# Altium schematic sheet ads1299_Ain.SchDoc
size A4
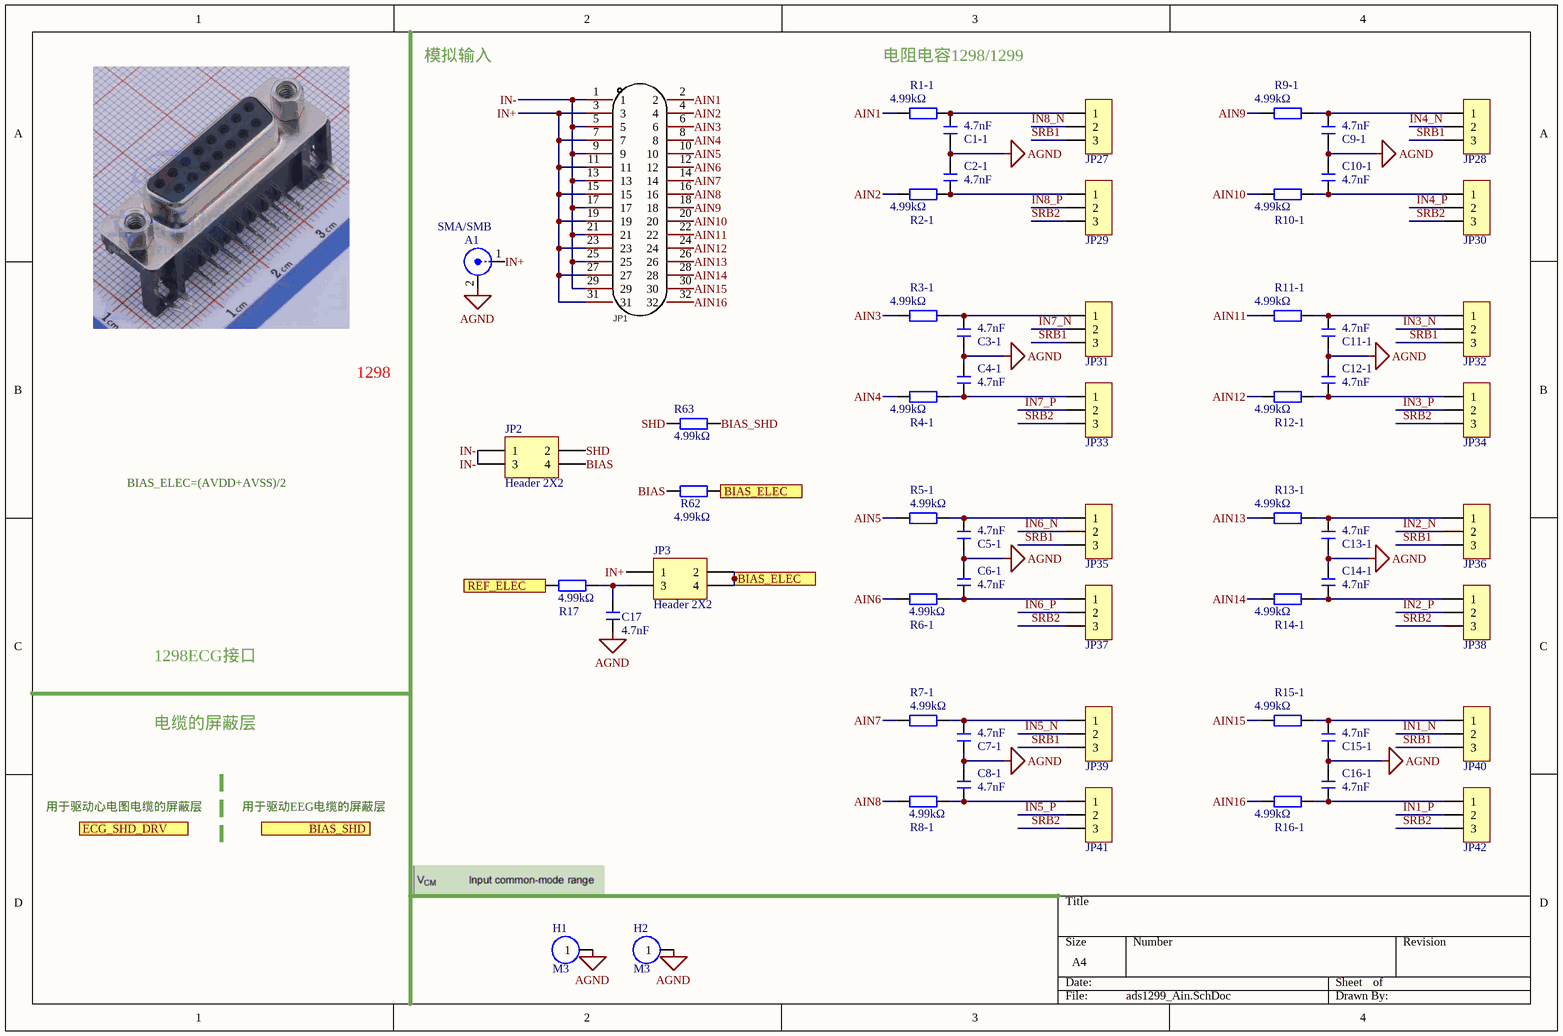
[diagram p0: ads1299_Ain.SchDoc]

## Parts
A1  SMA/SMB  [SMB_V-RJ45]
C1-1  4.7nF  [0603C]
C2-1  4.7nF  [0603C]
C3-1  4.7nF  [0603C]
C4-1  4.7nF  [0603C]
C5-1  4.7nF  [0603C]
C6-1  4.7nF  [0603C]
C7-1  4.7nF  [0603C]
C8-1  4.7nF  [0603C]
C9-1  4.7nF  [0603C]
C10-1  4.7nF  [0603C]
C11-1  4.7nF  [0603C]
C12-1  4.7nF  [0603C]
C13-1  4.7nF  [0603C]
C14-1  4.7nF  [0603C]
C15-1  4.7nF  [0603C]
C16-1  4.7nF  [0603C]
C17  4.7nF  [0603C]
H1  M3  [M3x4_L]
H2  M3  [M3x4_L]
JP1  B-2100S32P-B110  [HDR-TH_32P-P2.54-V-M-R2-C16-S2.54]  (value not drawn)
JP2  Header 2X2  [HDR2.54-LI-2x2P]
JP3  Header 2X2  [HDR2.54-LI-2x2P]
JP27  HDR-1X3  [HDR2.54-LI-3P]  (value not drawn)
JP28  HDR-1X3  [HDR2.54-LI-3P]  (value not drawn)
JP29  HDR-1X3  [HDR2.54-LI-3P]  (value not drawn)
JP30  HDR-1X3  [HDR2.54-LI-3P]  (value not drawn)
JP31  HDR-1X3  [HDR2.54-LI-3P]  (value not drawn)
JP32  HDR-1X3  [HDR2.54-LI-3P]  (value not drawn)
JP33  HDR-1X3  [HDR2.54-LI-3P]  (value not drawn)
JP34  HDR-1X3  [HDR2.54-LI-3P]  (value not drawn)
JP35  HDR-1X3  [HDR2.54-LI-3P]  (value not drawn)
JP36  HDR-1X3  [HDR2.54-LI-3P]  (value not drawn)
JP37  HDR-1X3  [HDR2.54-LI-3P]  (value not drawn)
JP38  HDR-1X3  [HDR2.54-LI-3P]  (value not drawn)
JP39  HDR-1X3  [HDR2.54-LI-3P]  (value not drawn)
JP40  HDR-1X3  [HDR2.54-LI-3P]  (value not drawn)
JP41  HDR-1X3  [HDR2.54-LI-3P]  (value not drawn)
JP42  HDR-1X3  [HDR2.54-LI-3P]  (value not drawn)
R1-1  4.99kΩ  [0603R]
R2-1  4.99kΩ  [0603R]
R3-1  4.99kΩ  [0603R]
R4-1  4.99kΩ  [0603R]
R5-1  4.99kΩ  [0603R]
R6-1  4.99kΩ  [0603R]
R7-1  4.99kΩ  [0603R]
R8-1  4.99kΩ  [0603R]
R9-1  4.99kΩ  [0603R]
R10-1  4.99kΩ  [0603R]
R11-1  4.99kΩ  [0603R]
R12-1  4.99kΩ  [0603R]
R13-1  4.99kΩ  [0603R]
R14-1  4.99kΩ  [0603R]
R15-1  4.99kΩ  [0603R]
R16-1  4.99kΩ  [0603R]
R17  4.99kΩ  [0603R]
R62  4.99kΩ  [0603R]
R63  4.99kΩ  [0603R]

## Ports
BIAS_ELEC, BIAS_SHD, ECG_SHD_DRV, REF_ELEC

## Nets
AGND: A1.2(Y) C1-1.1 C2-1.2 C3-1.1 C4-1.2 C5-1.1 C6-1.2 C7-1.1 C8-1.2 C9-1.1 C10-1.2 C11-1.1 C12-1.2 C13-1.1 C14-1.2 C15-1.1 C16-1.2 C17.1 H1.1 H2.1
AIN1: JP1.2 R1-1.1
AIN2: JP1.4 R2-1.1
AIN3: JP1.6 R3-1.1
AIN4: JP1.8 R4-1.1
AIN5: JP1.10 R5-1.1
AIN6: JP1.12 R6-1.1
AIN7: JP1.14 R7-1.1
AIN8: JP1.16 R8-1.1
AIN9: JP1.18 R9-1.1
AIN10: JP1.20 R10-1.1
AIN11: JP1.22 R11-1.1
AIN12: JP1.24 R12-1.1
AIN13: JP1.26 R13-1.1
AIN14: JP1.28 R14-1.1
AIN15: JP1.30 R15-1.1
AIN16: JP1.32 R16-1.1
BIAS: JP2.4 R62.1
BIAS_ELEC: JP3.2 JP3.4 R62.2 ; port BIAS_ELEC
BIAS_SHD: R63.2
IN1_N: JP40.2
IN1_P: JP42.2
IN2_N: JP36.2
IN2_P: JP38.2
IN3_N: JP32.2
IN3_P: JP34.2
IN4_N: JP28.2
IN4_P: JP30.2
IN5_N: JP39.2
IN5_P: JP41.2
IN6_N: JP35.2
IN6_P: JP37.2
IN7_N: JP31.2
IN7_P: JP33.2
IN8_N: JP27.2
IN8_P: JP29.2
IN+: A1.1(X) JP1.3 JP1.7 JP1.11 JP1.15 JP1.19 JP1.23 JP1.27 JP1.31 JP3.1
IN-: JP1.1 JP1.5 JP1.9 JP1.13 JP1.17 JP1.21 JP1.25 JP1.29 JP2.1 JP2.3
REF_ELEC: R17.1 ; port REF_ELEC
SHD: JP2.2 R63.1
SRB1: JP27.3 JP28.3 JP31.3 JP32.3 JP35.3 JP36.3 JP39.3 JP40.3
SRB2: JP29.3 JP30.3 JP33.3 JP34.3 JP37.3 JP38.3 JP41.3 JP42.3
NetC1-1_2: C1-1.2 JP27.1 R1-1.2
NetC2-1_1: C2-1.1 JP29.1 R2-1.2
NetC3-1_2: C3-1.2 JP31.1 R3-1.2
NetC4-1_1: C4-1.1 JP33.1 R4-1.2
NetC5-1_2: C5-1.2 JP35.1 R5-1.2
NetC6-1_1: C6-1.1 JP37.1 R6-1.2
NetC7-1_2: C7-1.2 JP39.1 R7-1.2
NetC8-1_1: C8-1.1 JP41.1 R8-1.2
NetC9-1_2: C9-1.2 JP28.1 R9-1.2
NetC10-1_1: C10-1.1 JP30.1 R10-1.2
NetC11-1_2: C11-1.2 JP32.1 R11-1.2
NetC12-1_1: C12-1.1 JP34.1 R12-1.2
NetC13-1_2: C13-1.2 JP36.1 R13-1.2
NetC14-1_1: C14-1.1 JP38.1 R14-1.2
NetC15-1_2: C15-1.2 JP40.1 R15-1.2
NetC16-1_1: C16-1.1 JP42.1 R16-1.2
NetC17_2: C17.2 JP3.3 R17.2

## Notes on the sheet
- 模拟输入
- 电阻电容1298/1299
- 1298
- BIAS_ELEC=(AVDD+AVSS)/2
- 1298ECG接口
- 电缆的屏蔽层
- 用于驱动心电图电缆的屏蔽层
- 用于驱动EEG电缆的屏蔽层

## Library data of the parts
A1 = SMB: SMB Straight Connector; LatestRevisionDate: 17-Jul-2002; LatestRevisionNote: Re-released for DXP Platform.; Publisher: Altium Limited
C1-1 C2-1 C3-1 C4-1 C5-1 C6-1 C7-1 C8-1 C9-1 C10-1 C11-1 C12-1 C13-1 C14-1 C15-1 C16-1 C17 = C: Chip  Ceramic Capacitor; BOM名称: 无极性贴片电容; 版权归属: 源创客; 学习资源: www.ooocke.com
H1 H2 = M3: 铜柱孔; 版权归属: 封装库来自淘宝 ID：黄晶宝石; BOM名称: 铜柱孔; 学习资源: https://shop463601444.taobao.com
JP1 = Header2*16P: Manufacturer: Ckmtw(灿科盟); Symbol: 210S-2*16P L=11.6MMGold-plated black; Add into BOM: yes; Pitch: 2.54mm; Pin Structure: 2x16P; Name: B-2100S32P-B110; Device: B-2100S32P-B110; LCSC Part Name: 2.54mm 2x16P 直插; Supplier Part: C124382; Manufacturer Part: B-2100S32P-B110; Supplier Footprint: 直插,P=2.54mm; JLCPCB Part Class: Extended Part; Datasheet: https://atta.szlcsc.com/upload/public/pdf/source/20170821/C124382_1503303309726901536.pdf; Supplier: LCSC; Convert to PCB: yes; Number of Rows: 双排; Number of Pins: 32; Row Spacing: 2.54mm; Mounting Type: 直插; Circluar Pins/Square Pins: -; Current Rating (Max): -; Voltage Rating (Max): -; Length of Mating Pin: 6mm; Insulation Height: 2.54mm; Length of End Connection Pin: 3mm; Contact Material: 黄铜; Contact Plating: -; Operating Temperature Range: -40℃~+105℃; Color: 黑色
JP2 JP3 = Header 2X2: Header, 2-Pin, Dual row; LatestRevisionDate: 17-Jul-2002; LatestRevisionNote: Re-released for DXP Platform.; Publisher: Altium Limited
JP27-JP42 = Header 3: 3P接插件; 版权归属: 源创客; BOM名称: 3P接插件; 学习资源: www.ooocke.com
R1-1 R2-1 R3-1 R4-1 R5-1 R6-1 R7-1 R8-1 R9-1 R10-1 R11-1 R12-1 R13-1 R14-1 R15-1 R16-1 R17 R62 R63 = R: 贴片电阻; 版权归属: 源创客; BOM名称: 贴片电阻; 学习资源: www.ooocke.com